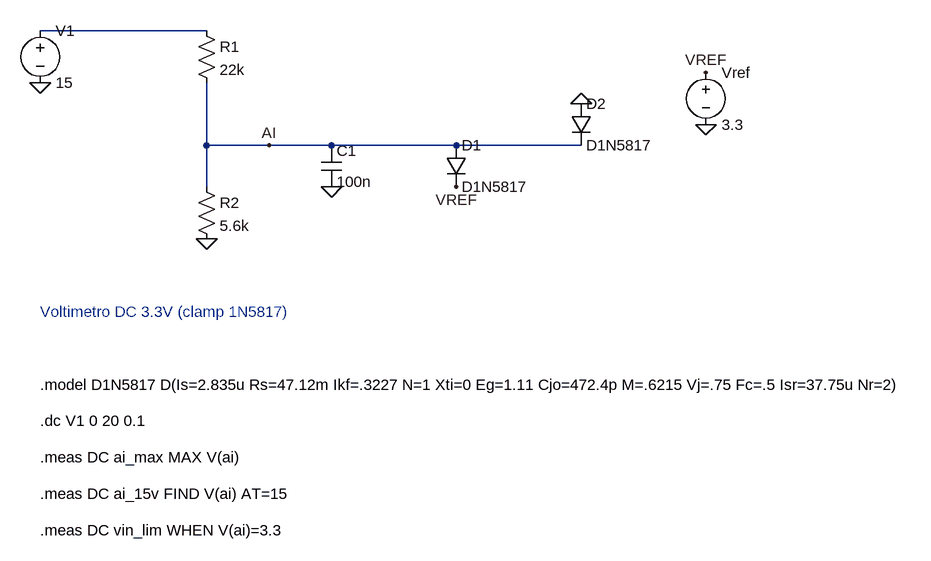
[diagram p0: schematic voltimetro_dc.asc]
voltimetro_dc.asc, the LTspice schematic file:
Version 4
SHEET 1 1300 920
WIRE 0 16 256 16
WIRE 256 96 256 192
WIRE 256 192 256 256
WIRE 256 192 352 192
WIRE 352 192 448 192
WIRE 448 192 640 192
WIRE 640 192 832 192
FLAG 0 96 0
FLAG 256 336 0
FLAG 352 192 AI
FLAG 448 256 0
FLAG 640 256 VREF
FLAG 832 128 0
FLAG 1024 80 VREF
FLAG 1024 160 0
SYMBOL voltage 0 0 R0
SYMATTR InstName V1
SYMATTR Value 15
SYMBOL res 240 0 R0
SYMATTR InstName R1
SYMATTR Value 22k
SYMBOL res 240 240 R0
SYMATTR InstName R2
SYMATTR Value 5.6k
SYMBOL cap 432 192 R0
SYMATTR InstName C1
SYMATTR Value 100n
SYMBOL diode 624 192 R0
SYMATTR InstName D1
SYMATTR Value D1N5817
SYMBOL diode 816 128 R0
SYMATTR InstName D2
SYMATTR Value D1N5817
SYMBOL voltage 1024 64 R0
SYMATTR InstName Vref
SYMATTR Value 3.3
TEXT 0 448 Left 2 ;Voltimetro DC 3.3V (clamp 1N5817)
TEXT 0 560 Left 2 !.model D1N5817 D(Is=2.835u Rs=47.12m Ikf=.3227 N=1 Xti=0 Eg=1.11 Cjo=472.4p M=.6215 Vj=.75 Fc=.5 Isr=37.75u Nr=2)
TEXT 0 616 Left 2 !.dc V1 0 20 0.1
TEXT 0 672 Left 2 !.meas DC ai_max MAX V(ai)
TEXT 0 728 Left 2 !.meas DC ai_15v FIND V(ai) AT=15
TEXT 0 784 Left 2 !.meas DC vin_lim WHEN V(ai)=3.3

The netlist it stands for:
* voltimetro_dc.asc
V1 N001 0 15
R1 N001 AI 22k
R2 AI 0 5.6k
C1 AI 0 100n
D1 AI VREF D1N5817
D2 0 AI D1N5817
Vref VREF 0 3.3
.model D D
.lib standard.dio
* Voltimetro DC 3.3V (clamp 1N5817)
.model D1N5817 D(Is=2.835u Rs=47.12m Ikf=.3227 N=1 Xti=0 Eg=1.11 Cjo=472.4p M=.6215 Vj=.75 Fc=.5 Isr=37.75u Nr=2)
.dc V1 0 20 0.1
.meas DC ai_max MAX V(ai)
.meas DC ai_15v FIND V(ai) AT=15
.meas DC vin_lim WHEN V(ai)=3.3
.backanno
.end